# Altium project simple_clock.PrjPcb
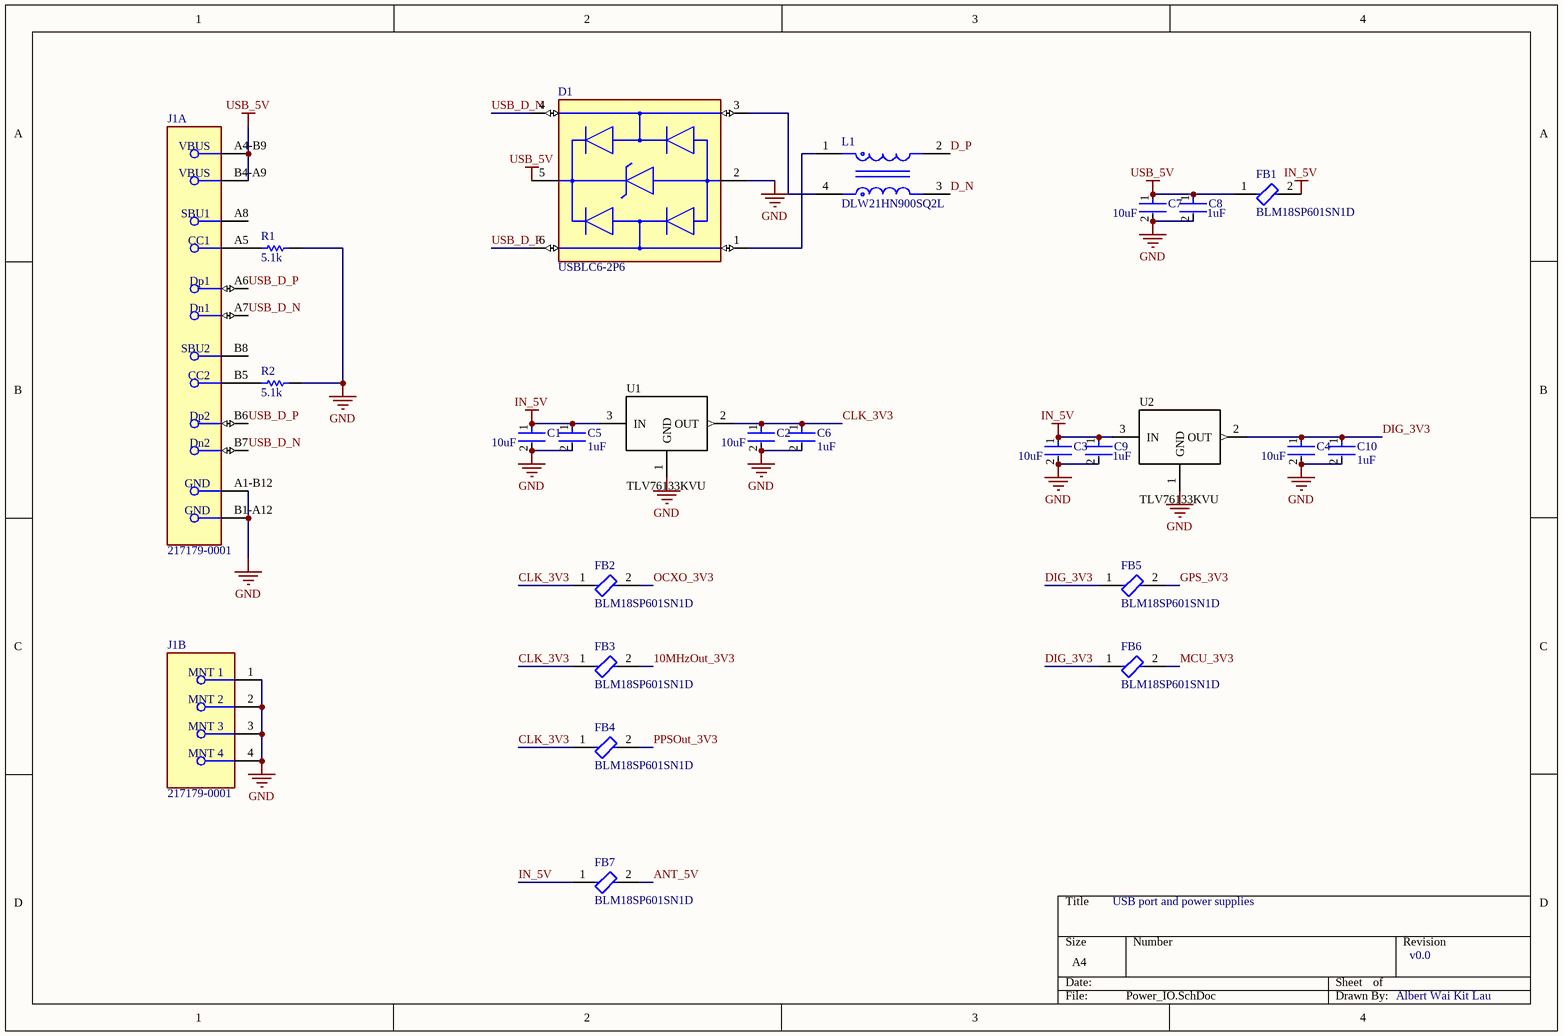
[diagram p0: Power_IO.SchDoc]
4 sheets, 88 parts. Net scope: global (net labels, ports and power ports of the same name join across sheets).
Board file: main.PcbDoc
Sheets:
  Power_IO.SchDoc
  MCU.SchDoc
  clocks.SchDoc
  Output_Distribute.SchDoc

## Sheet Power_IO.SchDoc
size A4; SheetNumber: 1; SheetTotal: 4

### Parts
C1  10uF  [FP-GRM21B-0_2-e0_2_0_7-IPC_A]
C2  10uF  [FP-GRM21B-0_2-e0_2_0_7-IPC_A]
C3  10uF  [FP-GRM21B-0_2-e0_2_0_7-IPC_A]
C4  10uF  [FP-GRM21B-0_2-e0_2_0_7-IPC_A]
C5  1uF  [FP-CL21-IPC_C]
C6  1uF  [FP-CL21-IPC_C]
C7  10uF  [FP-GRM21B-0_2-e0_2_0_7-IPC_A]
C8  1uF  [FP-CL21-IPC_C]
C9  1uF  [FP-CL21-IPC_C]
C10  1uF  [FP-CL21-IPC_C]
D1  USBLC6-2P6  [FP-SOT-666-MFG]
FB1  BLM18SP601SN1D  [FP-BLM18-0_15-t0_8-MFG]
FB2  BLM18SP601SN1D  [FP-BLM18-0_15-t0_8-MFG]
FB3  BLM18SP601SN1D  [FP-BLM18-0_15-t0_8-MFG]
FB4  BLM18SP601SN1D  [FP-BLM18-0_15-t0_8-MFG]
FB5  BLM18SP601SN1D  [FP-BLM18-0_15-t0_8-MFG]
FB6  BLM18SP601SN1D  [FP-BLM18-0_15-t0_8-MFG]
FB7  BLM18SP601SN1D  [FP-BLM18-0_15-t0_8-MFG]
J1  217179-0001  [FP-2171790001-MFG]  (parts A,B of 2)
L1  DLW21HN900SQ2L  [FP-DLW21HN-MFG]
R1  5.1k  [RESC1005X40X25LL10T10]
R2  5.1k  [RESC1005X40X25LL10T10]
U1  TLV76133KVU  [TO-252-3_KVU_TI_TabPin2]
U2  TLV76133KVU  [TO-252-3_KVU_TI_TabPin2]

### Nets
GND: C1.2 C2.2 C3.2 C4.2 C5.2 C6.2 C7.2 C8.2 C9.2 C10.2 D1.2(GND) J1.1(MNT_1) J1.2(MNT_2) J1.3(MNT_3) J1.4(MNT_4) J1.A1-B12(GND) J1.B1-A12(GND) R1.2 R2.2 U1.1(GND) U2.1(GND)
IN_5V: C1.1 C3.1 C5.1 C9.1 FB1.2 FB7.1 U1.3(IN) U2.3(IN)
USB_5V: C7.1 C8.1 D1.5(VBUS) FB1.1 J1.A4-B9(VBUS) J1.B4-A9(VBUS)
10MHzOut_3V3: FB3.2
ANT_5V: FB7.2
CLK_3V3: C2.1 C6.1 FB2.1 FB3.1 FB4.1 U1.2(OUT)
D_N: L1.3
D_P: L1.2
DIG_3V3: C4.1 C10.1 FB5.1 FB6.1 U2.2(OUT)
GPS_3V3: FB5.2
MCU_3V3: FB6.2
OCXO_3V3: FB2.2
PPSOut_3V3: FB4.2
USB_D_N: D1.4(I/O2) J1.A7(Dn1) J1.B7(Dn2)
USB_D_P: D1.6(I/O1) J1.A6(Dp1) J1.B6(Dp2)
NetD1_1: D1.1(I/O1) L1.1
NetD1_3: D1.3(I/O2) L1.4
NetJ1_A5: J1.A5(CC1) R1.1
NetJ1_B5: J1.B5(CC2) R2.1

Not connected (* = marked no-connect by the designer): J1 A8(SBU1) B8(SBU2)

### Notes on the sheet
- USB port and power supplies
- v0.0
- Albert Wai Kit Lau

### Library data of the parts
C1-C4 C7 = CMP-06035-004402-1: Chip Multilayer Ceramic Capacitors for General Purpose, 0805, 10uF, X5R, 15%, 10%, 50V; Voltage Rating (DC): 50V; Dielectric: X5R; Tolerance: 10%; Capacitance: 10uF; Thickness: 1.25mm; Length: 2mm; Width: 1.25mm; JLCPCB: C440198
C5 C6 C8-C10 = CMP-13271-004196-1: CL21 Series 0805 1uF 50V ±10% Tolerance X7R Multilayer Ceramic Chip Capacitor; Tolerance: 10%; Thickness: 0.053inch; Case/Package: 0805; Mount: Surface Mount; Depth: 1.25mm; Radiation Hardening: No; Voltage Rating: 50V; Max Operating Temperature: 125°C; Case Code (Imperial): 0805; Min Operating Temperature: -55°C; Length: 0.079inch; Dielectric: X7R; Case Code (Metric): 2012; Packaging: Tape and Reel; Width: 0.049inch; Package Quantity: 1; Capacitance: 1uF; Height: 1.25mm; JLCPCB: C28323
D1 = CMP-12225-000058-1: TVS DIODE 5.25V 17V SOT666; Min Breakdown Voltage: 6V; Power Line Protection: Yes; Element Configuration: Dual; Test Current: 1mA; Working Voltage: 5V; Number of Channels: 2; Max Reverse Leakage Current: 150nA; Direction: Unidirectional; Peak Pulse Current: 5A; Number of Elements: 1; Capacitance: 3.5pF; Max Breakdown Voltage: 6V; Height: 0.6mm; Depth: 1.3mm; Contact Plating: Tin; Reverse Breakdown Voltage: 6V; REACH SVHC: No SVHC; Operating Supply Voltage: 5V; Width: 1.3mm; Max Operating Temperature: 125°C; Reverse Standoff Voltage: 5V; ESD Protection: Yes; Package Quantity: 1; Termination: SMD/SMT; Length: 1.7mm; Leakage Current: 150nA; Number of Bidirectional Channels: 2; Case/Package: SOT-666; Min Operating Temperature: -40°C; Number of Pins: 6; Clamping Voltage: 17V; Breakdown Voltage: 6V; Lead Free: Lead Free; Radiation Hardening: No; Packaging: Tape and Reel; Mount: Surface Mount; Polarity: Unidirectional; JLCPCB: C15999
FB1-FB7 = CMP-00260-111572297-1: BLM18SP601SN1D Ferrite Bead, 600 Ohm, 1.5A, 0603 Rohs Compliant: Yes; Resistance: 140mΩ; Test Frequency: 100MHz; Tolerance: 25%; Height: 950µm; Min Operating Temperature: -55°C; NexarPartId: 111572297; Core Material: Ferrite; Max Operating Temperature: 125°C; Case/Package: 0603; Lifecycle Status: Production; Series Resistance: 140mΩ; RMS Current (Irms): 1.5A; JLCPCB: C3716583
J1 = CMP-04767-000028-2: CONN RCP USB2.0 TYP C 16P SMD RA; NexarPartId: 117190526; Gender: Receptacle; Number of Contacts: 16; Current Rating: 1.25A; Voltage Rating: 30V; Min Operating Temperature: -40°C; USB Standard: USB 2.0; Height: 3.36mm; Contact Material: Gold, Nickel; Max Operating Temperature: 85°C; JLCPCB: C3197684
L1 = CMP-06045-000050-1: CMC 330MA 2LN 90 OHM SMD; Tolerance: 25%; Frequency: 100MHz; Shielding: Unshielded; Impedance: 90R; Number of Lines: 2; DC Resistance (DCR): 350mR; Voltage Rating: 50V; DC Current: 330mA; Current Rating: 330mA; Lead Free: Lead Free; Length: 2mm; Radiation Hardening: No; Max Operating Temperature: 85°C; Depth: 1.2mm; Weight: 0.000317oz; Height: 0.9mm; Termination: SMD/SMT; Min Operating Temperature: -40°C; Case/Package: 0805; Packaging: Tape and Reel; Width: 0.047inch; Test Frequency: 100MHz; Mount: Surface Mount; Current: 330mA; Military Standard: Not; Package Quantity: 1; Resistor Type: Wirewound; Case Code (Imperial): 0805; Max DC Current: 330mA; JLCPCB: C80529
R1 R2 = CMP-2002-05746-1: Manufacturer: TE Connectivity / AMP; Part Number: CRG0402F5K1; JLCPCB: C25905
U1 U2 = TLV76133KVU: 18 V, 1 A fixed 3.3 V LDO regulator; TI KVU (TO-252); Manufacturer: Texas Instruments; Manufacturer Part Number: TLV76133KVUR; Output Voltage: 3.3 V; Output Current: 1 A; Package: KVU (TO-252-3); Datasheet: https://www.ti.com/lit/gpn/TLV761; JLCPCB: C41835077

## Sheet MCU.SchDoc
size A4; SheetNumber: 2; SheetTotal: 4
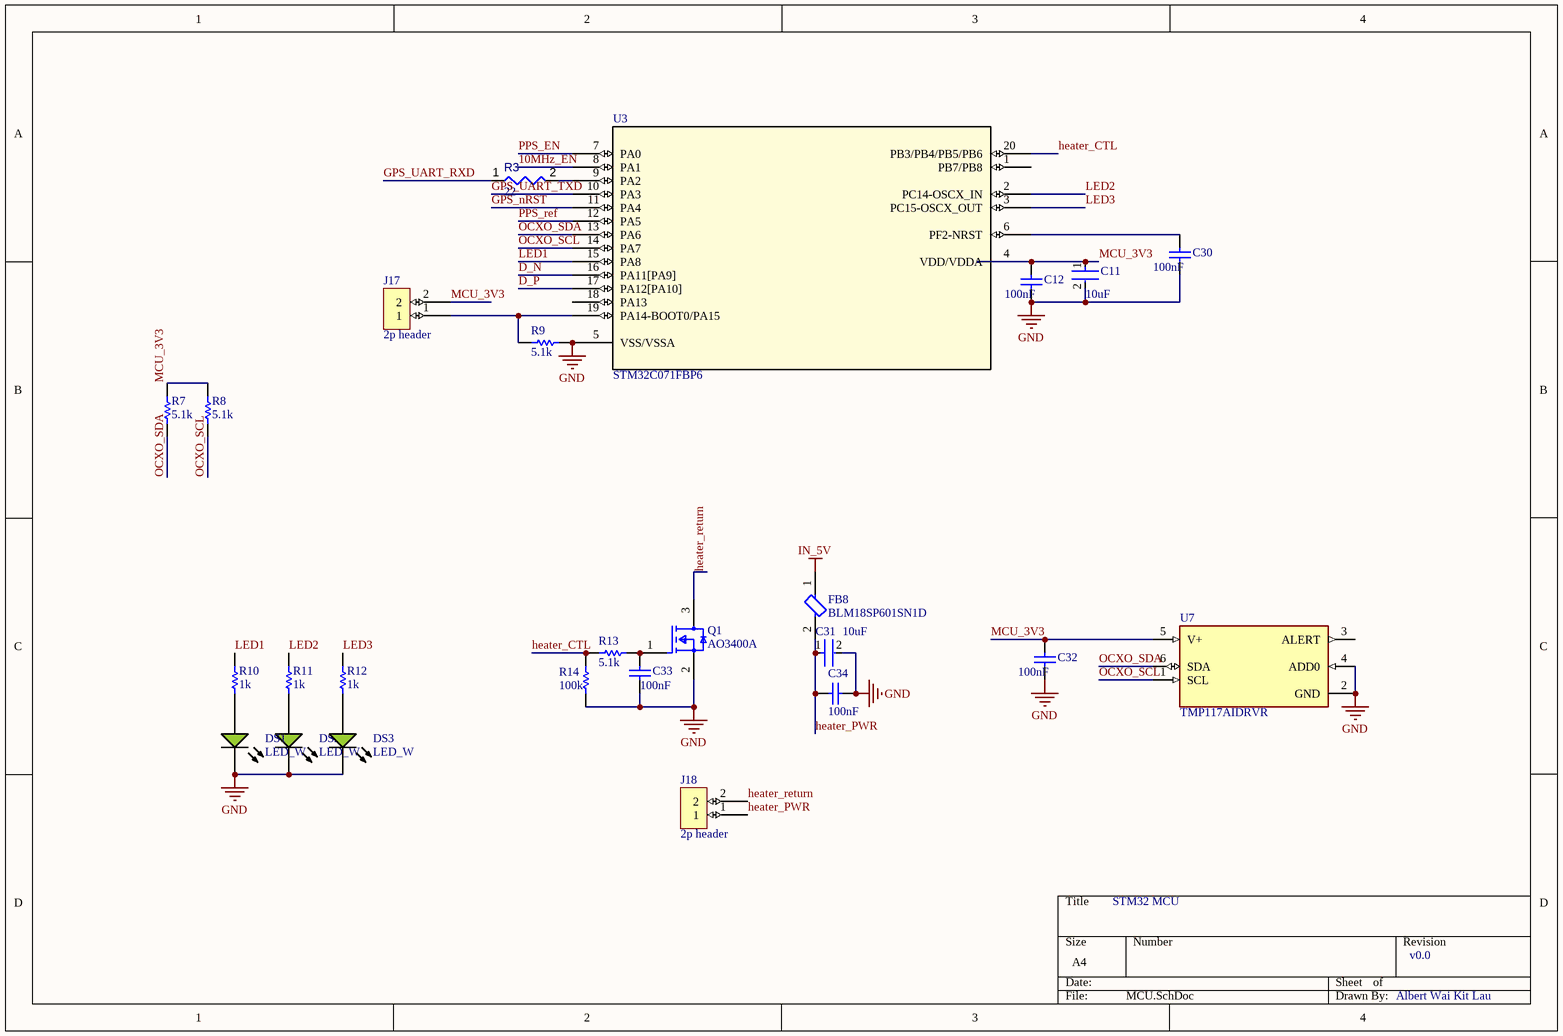
[diagram p1: MCU.SchDoc]

### Parts
C11  10uF  [FP-GRM21B-0_2-e0_2_0_7-IPC_A]
C12  100nF  [CAPC1050X55X23ML05T13]
C30  100nF  [CAPC1050X55X23ML05T13]
C31  10uF  [FP-GRM21B-0_2-e0_2_0_7-IPC_A]
C32  100nF  [CAPC1050X55X23ML05T13]
C33  100nF  [CAPC1050X55X23ML05T13]
C34  100nF  [CAPC1050X55X23ML05T13]
DS1  LED_W  [EVRL-0603-2_V]
DS2  LED_W  [EVRL-0603-2_V]
DS3  LED_W  [EVRL-0603-2_V]
FB8  BLM18SP601SN1D  [FP-BLM18-0_15-t0_8-MFG]
J17  2p header  [New footprint 1]
J18  2p header  [New footprint 1]
Q1  AO3400A  [FP-SOT23-MFG]
R3  value 22  [RESC0402(1005)_L]  (hidden comment: 22R2J)
R7  5.1k  [RESC1005X40X25LL10T10]
R8  5.1k  [RESC1005X40X25LL10T10]
R9  5.1k  [RESC1005X40X25LL10T10]
R10  value 1k  [RESC1005X40X25ML05T05]  (hidden comment: Resistor 1k +/-1% 0402 100 mW)
R11  value 1k  [RESC1005X40X25ML05T05]  (hidden comment: Resistor 1k +/-1% 0402 100 mW)
R12  value 1k  [RESC1005X40X25ML05T05]  (hidden comment: Resistor 1k +/-1% 0402 100 mW)
R13  5.1k  [RESC1005X40X25LL10T10]
R14  100k  [RESC1005X40X25LL10T10]
U3  STM32C071FBP6  [TSSOP20_STM]
U7  TMP117AIDRVR  [FP-DRV0006B-IPC_C]

### Nets
GND: C11.2 C12.2 C30.2 C31.2 C32.2 C33.2 C34.2 DS1.2(K) DS2.2(K) DS3.2(K) Q1.2(S) R9.2 R14.2 U3.5(VSS/VSSA) U7.2(GND) U7.4(ADD0)
IN_5V: FB8.1
10MHz_EN: U3.8(PA1)
D_N: U3.16(PA11[PA9])
D_P: U3.17(PA12[PA10])
GPS_nRST: U3.11(PA4)
GPS_UART_RXD: R3.1
GPS_UART_TXD: U3.10(PA3)
heater_CTL: R13.2 R14.1 U3.20(PB3/PB4/PB5/PB6)
heater_PWR: C31.1 C34.1 FB8.2 J18.1
heater_return: J18.2 Q1.3(D)
LED1: R10.2 U3.15(PA8)
LED2: R11.2 U3.2(PC14-OSCX_IN)
LED3: R12.2 U3.3(PC15-OSCX_OUT)
MCU_3V3: C11.1 C12.1 C32.1 J17.2 R7.2 R8.2 U3.4(VDD/VDDA) U7.5(V+)
OCXO_SCL: R8.1 U3.14(PA7) U7.1(SCL)
OCXO_SDA: R7.1 U3.13(PA6) U7.6(SDA)
PPS_EN: U3.7(PA0)
PPS_ref: U3.12(PA5)
NetC30_1: C30.1 U3.6(PF2-NRST)
NetC33_1: C33.1 Q1.1(G) R13.1
NetDS1_1: DS1.1(A) R10.1
NetDS2_1: DS2.1(A) R11.1
NetDS3_1: DS3.1(A) R12.1
NetJ17_1: J17.1 R9.1 U3.19(PA14-BOOT0/PA15)
NetR3_2: R3.2 U3.9(PA2)

Not connected (* = marked no-connect by the designer): U3 1(PB7/PB8) 18(PA13); U7 3(ALERT)

### Notes on the sheet
- STM32 MCU
- v0.0
- Albert Wai Kit Lau

### Library data of the parts
C11 C31 = CMP-06035-004402-1: as C1 on sheet Power_IO; Voltage Rating (DC): 50V; Dielectric: X5R; Tolerance: 10%; Capacitance: 10uF; Thickness: 1.25mm; Length: 2mm; Width: 1.25mm; JLCPCB: C440198
C12 C30 C32-C34 = CMP-2000-05439-1: Chip Capacitor, 100 nF, +/- 10%, 16 V, -55 to 125 degC, 0402 (1005 Metric), RoHS, Tape and Reel; Manufacturer: Samsung Electro-Mechanics; Capacitance: 100000pF; Dielectric: X7R; Rated Voltage: 16V; Case Size/Dimension: 0402; Tolerance (%): ±10%; Manufacturer URL: http://www.samsungsem.com/global/index.jsp; Datasheet URL: https://datasheet.ciiva.com/29198/458718-da-01-en-vs-kondensator-0402-29198423.pdf; Datasheet Version: Nov-10; JLCPCB: C1525
DS1-DS3 = CMP-007-00002-2: Chip LED, white; Manufacturer: Everlight Electronics; Forward Voltage: 2V; Lens Style: Clear; Viewing Angle: 120degrees; Colour: Green; Mounting Technology: SM; Datasheet Version: Rev. 1, 04/2006; Package Description: 2-Pin Surface Mount Device, Body 1.6 x 0.8 mm; RoHS Compliant: True; Package Reference: 0603; Pins: 2; Manufacturer URL: http://www.everlight.com/; Datasheet URL: https://datasheet.ciiva.com/48679/19-217-g7c-an1p2-3t-48679179.pdf; Case/Package: 0603; JLCPCB: C2290
FB8 = CMP-00260-111572297-1: as FB1 on sheet Power_IO; Height: 950µm; Min Operating Temperature: -55°C; NexarPartId: 111572297; Core Material: Ferrite; Max Operating Temperature: 125°C; Case/Package: 0603; Lifecycle Status: Production; Series Resistance: 140mΩ; RMS Current (Irms): 1.5A; JLCPCB: C3716583
J17 J18 = CMP-002-00072-1: simple 2p header
Q1 = CMP-83955-000006-1: MOSFET N-CH 30V 5.7A SOT23; Input Capacitance: 630pF; Number of Elements: 1; Rds On Max: 26.5mR; Max Power Dissipation: 1.4W; Gate to Source Voltage (Vgs): 12V; Min Operating Temperature: -55°C; Lead Free: Lead Free; Number of Pins: 3; Drain to Source Voltage (Vdss): 30V; Case/Package: SOT-23; Mount: Surface Mount; Continuous Drain Current (ID): 5.7A; Radiation Hardening: No; Packaging: Tape and Reel; Max Operating Temperature: 150°C; Power Dissipation: 1.4W; JLCPCB: C20917
R3 = CMP-009-00082-2: 22R 0.063W 5% 0402 (1005 Metric)  SMD; Power: 63mW; Tolerance: 5%; Case/Package: 0402; Pins: 2; Mounting Technology: SMT; JLCPCB: C25092
R7-R9 R13 R14 = CMP-2002-05746-1: as R1 on sheet Power_IO
  R7-R9 R13: JLCPCB: C25905
  R14: JLCPCB: C25741
R10-R12 = CMP-009-00009-5: Chip Resistor, 1 KOhm, +/- 1%, 0.1 W, -55 to 155 degC, 0402 (1005 Metric); Power: 100mW; Voltage Rating: 50V; Min Operating Temperature: -55°C; Max Operating Temperature: 155°C; RoHS Compliant: True; Mounting Technology: SM; Pins: 2; Tolerance: 1%; Case/Package: 0402; JLCPCB: C11702
U3 = STM32C071FBP6: Mainstream Arm Cortex-M0+ MCU with 128 Kbytes of Flash memory, 24 Kbytes RAM, 48 MHz CPU, 2x USART, timers, ADC, comm. I/F, USB FS, 2-3.6V; Manufacturer_Name: STMicroelectronics; Copyright: Copyright (C) 2026 Ultra Librarian. All rights reserved.; Manufacturer_Part_Number: STM32C071FBP6; Datasheet: https://www.st.com/resource/en/datasheet/stm32c071c8.pdf; RefDes: RefDes; Type: Type
U7 = CMP-04948-000036-1: TEMPERATURE SENSOR; Resolution: 16b; Output Type: I2C; Packaging: Cut Tape; Mount: Surface Mount; Min Operating Temperature: -55°C; Max Operating Temperature: 150°C; RoHS Compliant: Yes; JLCPCB: C699536

## Sheet clocks.SchDoc
size A4; SheetNumber: 3; SheetTotal: 4
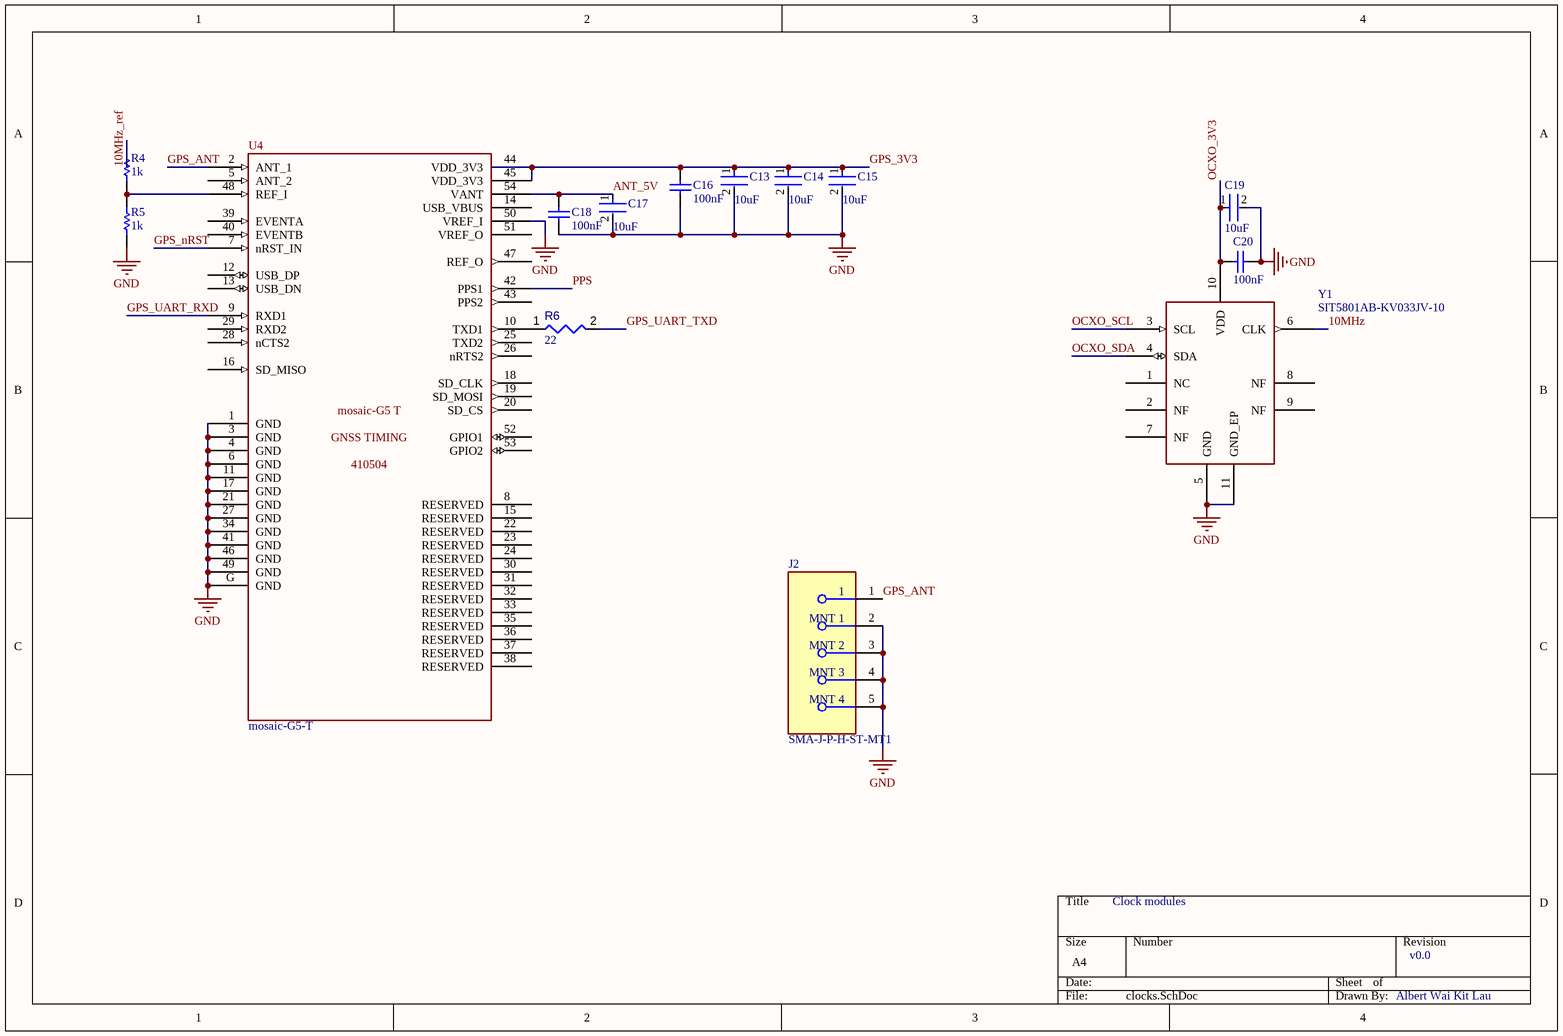
[diagram p2: clocks.SchDoc]

### Parts
C13  10uF  [FP-GRM21B-0_2-e0_2_0_7-IPC_A]
C14  10uF  [FP-GRM21B-0_2-e0_2_0_7-IPC_A]
C15  10uF  [FP-GRM21B-0_2-e0_2_0_7-IPC_A]
C16  100nF  [CAPC1050X55X23ML05T13]
C17  10uF  [FP-GRM21B-0_2-e0_2_0_7-IPC_A]
C18  100nF  [CAPC1050X55X23ML05T13]
C19  10uF  [FP-GRM21B-0_2-e0_2_0_7-IPC_A]
C20  100nF  [CAPC1050X55X23ML05T13]
J2  SMA-J-P-H-ST-MT1  [FP-SMA-J-P-H-ST-MT1-MFG]
R4  value 1k  [RESC1005X40X25ML05T05]  (hidden comment: Resistor 1k +/-1% 0402 100 mW)
R5  value 1k  [RESC1005X40X25ML05T05]  (hidden comment: Resistor 1k +/-1% 0402 100 mW)
R6  value 22  [RESC0402(1005)_L]  (hidden comment: 22R2J)
U4  mosaic-G5-T  [MOSAIC-G5_LGA54_22P8X16P4]
Y1  SIT5801AB-KV033JV-10  [SiT5801_K_9x7_LGA11]

### Nets
GND: C13.2 C14.2 C15.2 C16.2 C17.2 C18.2 C19.2 C20.1 J2.2(MNT_1) J2.3(MNT_2) J2.4(MNT_3) J2.5(MNT_4) R5.1 U4.1(GND) U4.3(GND) U4.4(GND) U4.6(GND) U4.11(GND) U4.17(GND) U4.21(GND) U4.27(GND) U4.34(GND) U4.41(GND) U4.46(GND) U4.49(GND) U4.50(VREF_I) U4.G(GND) Y1.5(GND) Y1.11(GND_EP)
10MHz: Y1.6(CLK)
10MHz_ref: R4.2
ANT_5V: C17.1 C18.1 U4.54(VANT)
GPS_3V3: C13.1 C14.1 C15.1 C16.1 U4.44(VDD_3V3) U4.45(VDD_3V3)
GPS_ANT: J2.1 U4.2(ANT_1)
GPS_nRST: U4.7(nRST_IN)
GPS_UART_RXD: U4.9(RXD1)
GPS_UART_TXD: R6.2
OCXO_3V3: C19.1 C20.2 Y1.10(VDD)
OCXO_SCL: Y1.3(SCL)
OCXO_SDA: Y1.4(SDA)
PPS: U4.42(PPS1)
NetR4_1: R4.1 R5.2 U4.48(REF_I)
NetR6_1: R6.1 U4.10(TXD1)

Not connected (* = marked no-connect by the designer): U4 5(ANT_2) 8(RESERVED) 12(USB_DP) 13(USB_DN) 14(USB_VBUS) 15(RESERVED) 16(SD_MISO) 18(SD_CLK) 19(SD_MOSI) 20(SD_CS) 22(RESERVED) 23(RESERVED) 24(RESERVED) 25(TXD2) 26(nRTS2) 28(nCTS2) 29(RXD2) 30(RESERVED) 31(RESERVED) 32(RESERVED) 33(RESERVED) 35(RESERVED) 36(RESERVED) 37(RESERVED) 38(RESERVED) 39(EVENTA) 40(EVENTB) 43(PPS2) 47(REF_O) 51(VREF_O) 52(GPIO1) 53(GPIO2); Y1 1(NC) 2(NF) 7(NF) 8(NF) 9(NF)

### Notes on the sheet
- Clock modules
- v0.0
- Albert Wai Kit Lau
- (in symbol mosaic-G5-T) mosaic-G5 T; GNSS TIMING; 410504

### Library data of the parts
C13-C15 C17 C19 = CMP-06035-004402-1: as C1 on sheet Power_IO; Voltage Rating (DC): 50V; Dielectric: X5R; Tolerance: 10%; Capacitance: 10uF; Thickness: 1.25mm; Length: 2mm; Width: 1.25mm; JLCPCB: C440198
C16 C18 C20 = CMP-2000-05439-1: as C12 on sheet MCU; Case Size/Dimension: 0402; Tolerance (%): ±10%; Manufacturer URL: http://www.samsungsem.com/global/index.jsp; Datasheet URL: https://datasheet.ciiva.com/29198/458718-da-01-en-vs-kondensator-0402-29198423.pdf; Datasheet Version: Nov-10; JLCPCB: C1525
J2 = CMP-002-00073-1: RF Connectors / Coaxial Connectors 6 GHz, 50 Ohm SMA Jack or Plug, Cable Connector; Case/Package: SMA; Mounting Technology: Through Hole
R4 R5 = CMP-009-00009-5: as R10 on sheet MCU; Min Operating Temperature: -55°C; Max Operating Temperature: 155°C; RoHS Compliant: True; Mounting Technology: SM; Pins: 2; Tolerance: 1%; Case/Package: 0402; JLCPCB: C11702
R6 = CMP-009-00082-2: as R3 on sheet MCU; Tolerance: 5%; Case/Package: 0402; Pins: 2; Mounting Technology: SMT; JLCPCB: C25092
U4 = mosaic-G5-T: Septentrio mosaic-G5 T multi-frequency GNSS timing receiver module, manufacturer part 410504. The 40 internal ground lands are represented by logical pin G and must be tied to ground. Pin 5 (ANT_2) is unsupported on the single-antenna T model and must be left unconnected.; pin to pad: G>G01
Y1 = SIT5801AB-KV033JV-10: SiTime SiT5801 10 MHz digitally controlled precision OCXO, exact AB-KV033JV-10 ordering variant; Frequency: 10 MHz; Supply Voltage: 3.3 V; Output: Regulated LVCMOS; Frequency Stability: ±3 ppb; Control Interface: I2C, factory-programmed address code 0; Pull Clamp: ±3.125 ppm; Manufacturer: SiTime; Manufacturer Part Number: SIT5801AB-KV033JV-10; Operating Temperature: -40 to +95 °C; Datasheet: SiT5801 Rev 0.26 (2023-05-04)

## Sheet Output_Distribute.SchDoc
size A4; SheetNumber: 4; SheetTotal: 4
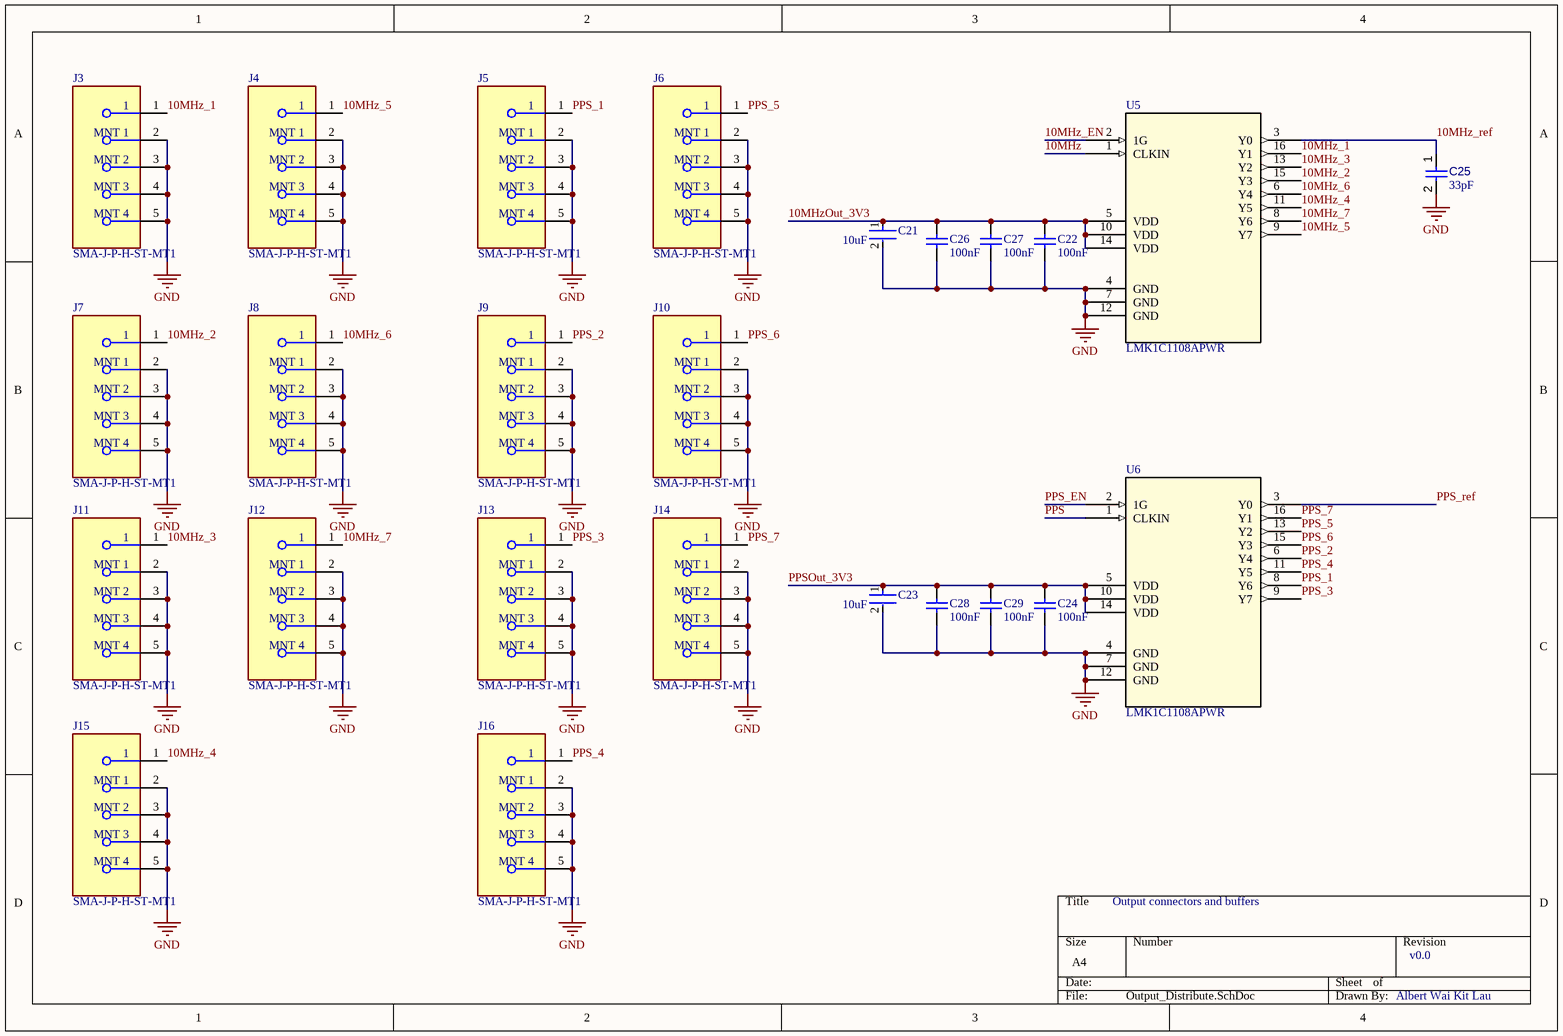
[diagram p3: Output_Distribute.SchDoc]

### Parts
C21  10uF  [FP-GRM21B-0_2-e0_2_0_7-IPC_A]
C22  100nF  [CAPC1050X55X23ML05T13]
C23  10uF  [FP-GRM21B-0_2-e0_2_0_7-IPC_A]
C24  100nF  [CAPC1050X55X23ML05T13]
C25  value 33pF  [CAPC1005X56X25ML10T15]  (hidden comment: Capacitor 0.5 pF +/- 0.1pF 25 V 0402)
C26  100nF  [CAPC1050X55X23ML05T13]
C27  100nF  [CAPC1050X55X23ML05T13]
C28  100nF  [CAPC1050X55X23ML05T13]
C29  100nF  [CAPC1050X55X23ML05T13]
J3  SMA-J-P-H-ST-MT1  [FP-SMA-J-P-H-ST-MT1-MFG]
J4  SMA-J-P-H-ST-MT1  [FP-SMA-J-P-H-ST-MT1-MFG]
J5  SMA-J-P-H-ST-MT1  [FP-SMA-J-P-H-ST-MT1-MFG]
J6  SMA-J-P-H-ST-MT1  [FP-SMA-J-P-H-ST-MT1-MFG]
J7  SMA-J-P-H-ST-MT1  [FP-SMA-J-P-H-ST-MT1-MFG]
J8  SMA-J-P-H-ST-MT1  [FP-SMA-J-P-H-ST-MT1-MFG]
J9  SMA-J-P-H-ST-MT1  [FP-SMA-J-P-H-ST-MT1-MFG]
J10  SMA-J-P-H-ST-MT1  [FP-SMA-J-P-H-ST-MT1-MFG]
J11  SMA-J-P-H-ST-MT1  [FP-SMA-J-P-H-ST-MT1-MFG]
J12  SMA-J-P-H-ST-MT1  [FP-SMA-J-P-H-ST-MT1-MFG]
J13  SMA-J-P-H-ST-MT1  [FP-SMA-J-P-H-ST-MT1-MFG]
J14  SMA-J-P-H-ST-MT1  [FP-SMA-J-P-H-ST-MT1-MFG]
J15  SMA-J-P-H-ST-MT1  [FP-SMA-J-P-H-ST-MT1-MFG]
J16  SMA-J-P-H-ST-MT1  [FP-SMA-J-P-H-ST-MT1-MFG]
U5  LMK1C1108APWR  [TSSOP16_4P5X5P1_TEX]
U6  LMK1C1108APWR  [TSSOP16_4P5X5P1_TEX]

### Nets
GND: C21.2 C22.2 C23.2 C24.2 C25.2 C26.2 C27.2 C28.2 C29.2 J3.2(MNT_1) J3.3(MNT_2) J3.4(MNT_3) J3.5(MNT_4) J4.2(MNT_1) J4.3(MNT_2) J4.4(MNT_3) J4.5(MNT_4) J5.2(MNT_1) J5.3(MNT_2) J5.4(MNT_3) J5.5(MNT_4) J6.2(MNT_1) J6.3(MNT_2) J6.4(MNT_3) J6.5(MNT_4) J7.2(MNT_1) J7.3(MNT_2) J7.4(MNT_3) J7.5(MNT_4) J8.2(MNT_1) J8.3(MNT_2) J8.4(MNT_3) J8.5(MNT_4) J9.2(MNT_1) J9.3(MNT_2) J9.4(MNT_3) J9.5(MNT_4) J10.2(MNT_1) J10.3(MNT_2) J10.4(MNT_3) J10.5(MNT_4) J11.2(MNT_1) J11.3(MNT_2) J11.4(MNT_3) J11.5(MNT_4) J12.2(MNT_1) J12.3(MNT_2) J12.4(MNT_3) J12.5(MNT_4) J13.2(MNT_1) J13.3(MNT_2) J13.4(MNT_3) J13.5(MNT_4) J14.2(MNT_1) J14.3(MNT_2) J14.4(MNT_3) J14.5(MNT_4) J15.2(MNT_1) J15.3(MNT_2) J15.4(MNT_3) J15.5(MNT_4) J16.2(MNT_1) J16.3(MNT_2) J16.4(MNT_3) J16.5(MNT_4) U5.4(GND) U5.7(GND) U5.12(GND) U6.4(GND) U6.7(GND) U6.12(GND)
10MHz: U5.1(CLKIN)
10MHz_1: J3.1 U5.16(Y1)
10MHz_2: J7.1 U5.15(Y3)
10MHz_3: J11.1 U5.13(Y2)
10MHz_4: J15.1 U5.11(Y5)
10MHz_5: J4.1 U5.9(Y7)
10MHz_6: J8.1 U5.6(Y4)
10MHz_7: J12.1 U5.8(Y6)
10MHz_EN: U5.2(1G)
10MHz_ref: C25.1 U5.3(Y0)
10MHzOut_3V3: C21.1 C22.1 C26.1 C27.1 U5.5(VDD) U5.10(VDD) U5.14(VDD)
PPS: U6.1(CLKIN)
PPS_1: J5.1 U6.8(Y6)
PPS_2: J9.1 U6.6(Y4)
PPS_3: J13.1 U6.9(Y7)
PPS_4: J16.1 U6.11(Y5)
PPS_5: J6.1 U6.13(Y2)
PPS_6: J10.1 U6.15(Y3)
PPS_7: J14.1 U6.16(Y1)
PPS_EN: U6.2(1G)
PPS_ref: U6.3(Y0)
PPSOut_3V3: C23.1 C24.1 C28.1 C29.1 U6.5(VDD) U6.10(VDD) U6.14(VDD)

### Notes on the sheet
- Output connectors and buffers
- v0.0
- Albert Wai Kit Lau

### Library data of the parts
C21 C23 = CMP-06035-004402-1: as C1 on sheet Power_IO; Voltage Rating (DC): 50V; Dielectric: X5R; Tolerance: 10%; Capacitance: 10uF; Thickness: 1.25mm; Length: 2mm; Width: 1.25mm; JLCPCB: C440198
C22 C24 C26-C29 = CMP-2000-05439-1: as C12 on sheet MCU; Case Size/Dimension: 0402; Tolerance (%): ±10%; Manufacturer URL: http://www.samsungsem.com/global/index.jsp; Datasheet URL: https://datasheet.ciiva.com/29198/458718-da-01-en-vs-kondensator-0402-29198423.pdf; Datasheet Version: Nov-10; JLCPCB: C1525
C25 = CMP-001-00002-6: Voltage Rating: 25V; Tolerance: 20%; Capacitor Type: Ceramic; Max Operating Temperature: 125°C; Case/Package: 0402; Pins: 2; RoHS Compliant: True; Min Operating Temperature: -55°C; Mounting Technology: SM; JLCPCB: C76905
J3-J16 = CMP-002-00073-1: as J2 on sheet clocks; Case/Package: SMA; Mounting Technology: Through Hole
U5 U6 = LMK1C1108APWR: 1.8V,2.5V or 3.3V asynchronous 8 channel output LVCMOS buffer 16-TSSOP -40 to 125; Manufacturer_Name: Texas Instruments; Copyright: Copyright (C) 2026 Ultra Librarian. All rights reserved.; Manufacturer_Part_Number: LMK1C1108APWR; RefDes: RefDes; Type: Type

## Nets that join several sheets
GND: Power_IO (21 pins), MCU (16 pins), clocks (29 pins), Output_Distribute (71 pins)
IN_5V: Power_IO (8 pins), MCU (FB8.1)
10MHz: clocks (Y1.6), Output_Distribute (U5.1)
10MHz_EN: MCU (U3.8), Output_Distribute (U5.2)
10MHz_ref: clocks (R4.2), Output_Distribute (C25.1 U5.3)
10MHzOut_3V3: Power_IO (FB3.2), Output_Distribute (7 pins)
ANT_5V: Power_IO (FB7.2), clocks (C17.1 C18.1 U4.54)
D_N: Power_IO (L1.3), MCU (U3.16)
D_P: Power_IO (L1.2), MCU (U3.17)
GPS_3V3: Power_IO (FB5.2), clocks (6 pins)
GPS_nRST: MCU (U3.11), clocks (U4.7)
GPS_UART_RXD: MCU (R3.1), clocks (U4.9)
GPS_UART_TXD: MCU (U3.10), clocks (R6.2)
MCU_3V3: Power_IO (FB6.2), MCU (8 pins)
OCXO_3V3: Power_IO (FB2.2), clocks (C19.1 C20.2 Y1.10)
OCXO_SCL: MCU (R8.1 U3.14 U7.1), clocks (Y1.3)
OCXO_SDA: MCU (R7.1 U3.13 U7.6), clocks (Y1.4)
PPS: clocks (U4.42), Output_Distribute (U6.1)
PPS_EN: MCU (U3.7), Output_Distribute (U6.2)
PPS_ref: MCU (U3.12), Output_Distribute (U6.3)
PPSOut_3V3: Power_IO (FB4.2), Output_Distribute (7 pins)